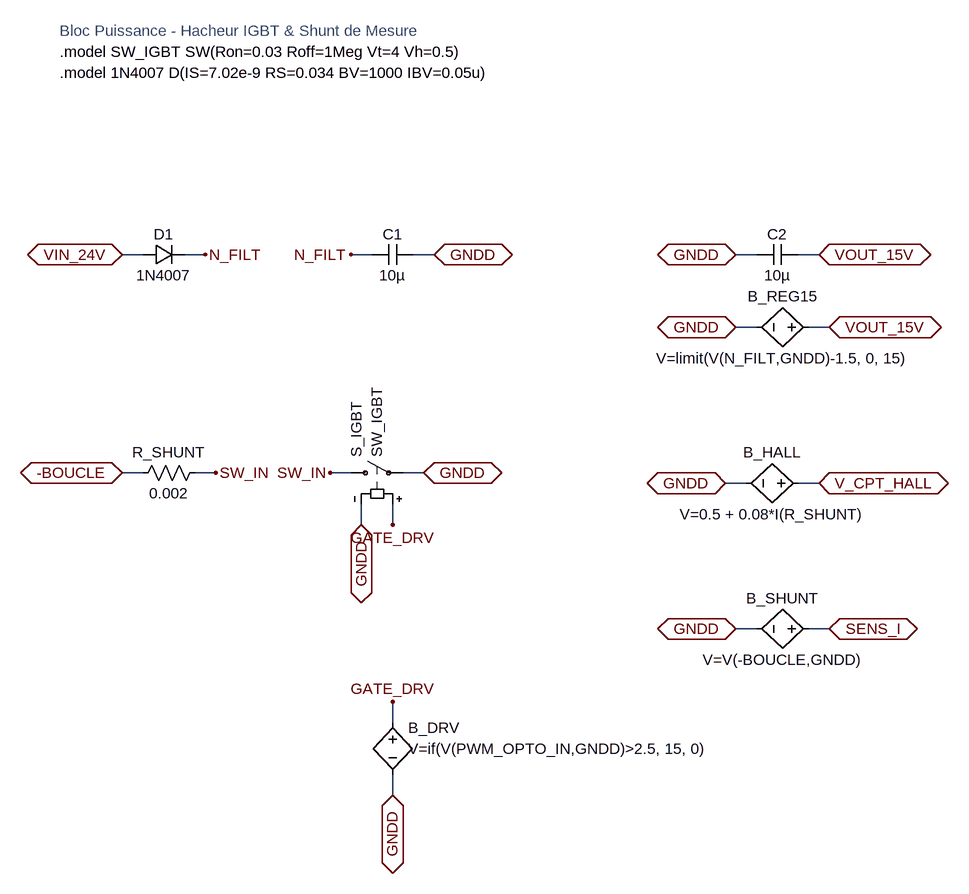
[diagram p0: schematic bloc_puissance.asc]
bloc_puissance.asc, the LTspice schematic file:
Version 4.1
SHEET 1 3200 2400
WIRE -864 336 -896 336
WIRE -768 336 -800 336
WIRE -512 336 -544 336
WIRE -416 336 -448 336
WIRE 80 336 48 336
WIRE 176 336 144 336
WIRE 80 448 48 448
WIRE 192 448 160 448
WIRE -864 672 -896 672
WIRE -752 672 -784 672
WIRE -544 672 -576 672
WIRE -432 672 -464 672
WIRE 64 688 32 688
WIRE 176 688 144 688
WIRE -528 752 -528 720
WIRE -480 752 -480 720
WIRE 80 912 48 912
WIRE 192 912 160 912
WIRE -480 1056 -480 1024
WIRE -480 1168 -480 1136
FLAG -896 336 VIN_24V
IOPIN -896 336 BiDir
FLAG -768 336 N_FILT
FLAG -544 336 N_FILT
FLAG -416 336 GNDD
IOPIN -416 336 BiDir
FLAG 192 448 VOUT_15V
IOPIN 192 448 BiDir
FLAG 48 448 GNDD
IOPIN 48 448 BiDir
FLAG 176 336 VOUT_15V
IOPIN 176 336 BiDir
FLAG 48 336 GNDD
IOPIN 48 336 BiDir
FLAG -480 1024 GATE_DRV
FLAG -480 1168 GNDD
IOPIN -480 1168 BiDir
FLAG -896 672 -BOUCLE
IOPIN -896 672 BiDir
FLAG -752 672 SW_IN
FLAG -576 672 SW_IN
FLAG -432 672 GNDD
IOPIN -432 672 BiDir
FLAG -480 752 GATE_DRV
FLAG -528 752 GNDD
IOPIN -528 752 BiDir
FLAG 176 688 V_CPT_HALL
IOPIN 176 688 BiDir
FLAG 32 688 GNDD
IOPIN 32 688 BiDir
FLAG 192 912 SENS_I
IOPIN 192 912 BiDir
FLAG 48 912 GNDD
IOPIN 48 912 BiDir
SYMBOL diode -864 352 R270
WINDOW 0 32 32 VTop 2
WINDOW 3 0 32 VBottom 2
SYMATTR InstName D1
SYMATTR Value 1N4007
SYMBOL cap -512 352 R270
WINDOW 0 32 32 VTop 2
WINDOW 3 0 32 VBottom 2
SYMATTR InstName C1
SYMATTR Value 10µ
SYMBOL bv 176 448 R90
WINDOW 0 -32 56 VBottom 2
WINDOW 3 32 56 VTop 2
SYMATTR InstName B_REG15
SYMATTR Value V=limit(V(N_FILT,GNDD)-1.5, 0, 15)
SYMBOL cap 144 320 R90
WINDOW 0 0 32 VBottom 2
WINDOW 3 32 32 VTop 2
SYMATTR InstName C2
SYMATTR Value 10µ
SYMBOL bv -480 1040 R0
WINDOW 0 24 24 Left 2
WINDOW 3 24 56 Left 2
SYMATTR InstName B_DRV
SYMATTR Value V=if(V(PWM_OPTO_IN,GNDD)>2.5, 15, 0)
SYMBOL res -880 688 R270
WINDOW 0 32 56 VTop 2
WINDOW 3 0 56 VBottom 2
SYMATTR InstName R_SHUNT
SYMATTR Value 0.002
SYMBOL sw -560 672 R270
WINDOW 0 24 24 Left 2
WINDOW 3 24 56 Left 2
SYMATTR InstName S_IGBT
SYMATTR Value SW_IGBT
SYMBOL bv 160 688 R90
WINDOW 0 -32 56 VBottom 2
WINDOW 3 32 56 VTop 2
SYMATTR InstName B_HALL
SYMATTR Value V=0.5 + 0.08*I(R_SHUNT)
SYMBOL bv 176 912 R90
WINDOW 0 -32 56 VBottom 2
WINDOW 3 32 56 VTop 2
SYMATTR InstName B_SHUNT
SYMATTR Value V=V(-BOUCLE,GNDD)
TEXT -992 -8 Left 2 ;Bloc Puissance - Hacheur IGBT & Shunt de Mesure
TEXT -992 24 Left 2 !.model SW_IGBT SW(Ron=0.03 Roff=1Meg Vt=4 Vh=0.5)
TEXT -992 56 Left 2 !.model 1N4007 D(IS=7.02e-9 RS=0.034 BV=1000 IBV=0.05u)

The netlist it stands for:
* bloc_puissance.asc
D1 VIN_24V N_FILT 1N4007
C1 N_FILT GNDD 10µ
B_REG15 VOUT_15V GNDD V=limit(V(N_FILT,GNDD)-1.5, 0, 15)
C2 VOUT_15V GNDD 10µ
B_DRV GATE_DRV GNDD V=if(V(PWM_OPTO_IN,GNDD)>2.5, 15, 0)
R_SHUNT -BOUCLE SW_IN 0.002
S_IGBT SW_IN GNDD GATE_DRV GNDD SW_IGBT
B_HALL V_CPT_HALL GNDD V=0.5 + 0.08*I(R_SHUNT)
B_SHUNT SENS_I GNDD V=V(-BOUCLE,GNDD)
.model D D
.lib standard.dio
* Bloc Puissance - Hacheur IGBT & Shunt de Mesure
.model SW_IGBT SW(Ron=0.03 Roff=1Meg Vt=4 Vh=0.5)
.model 1N4007 D(IS=7.02e-9 RS=0.034 BV=1000 IBV=0.05u)
.backanno
.end